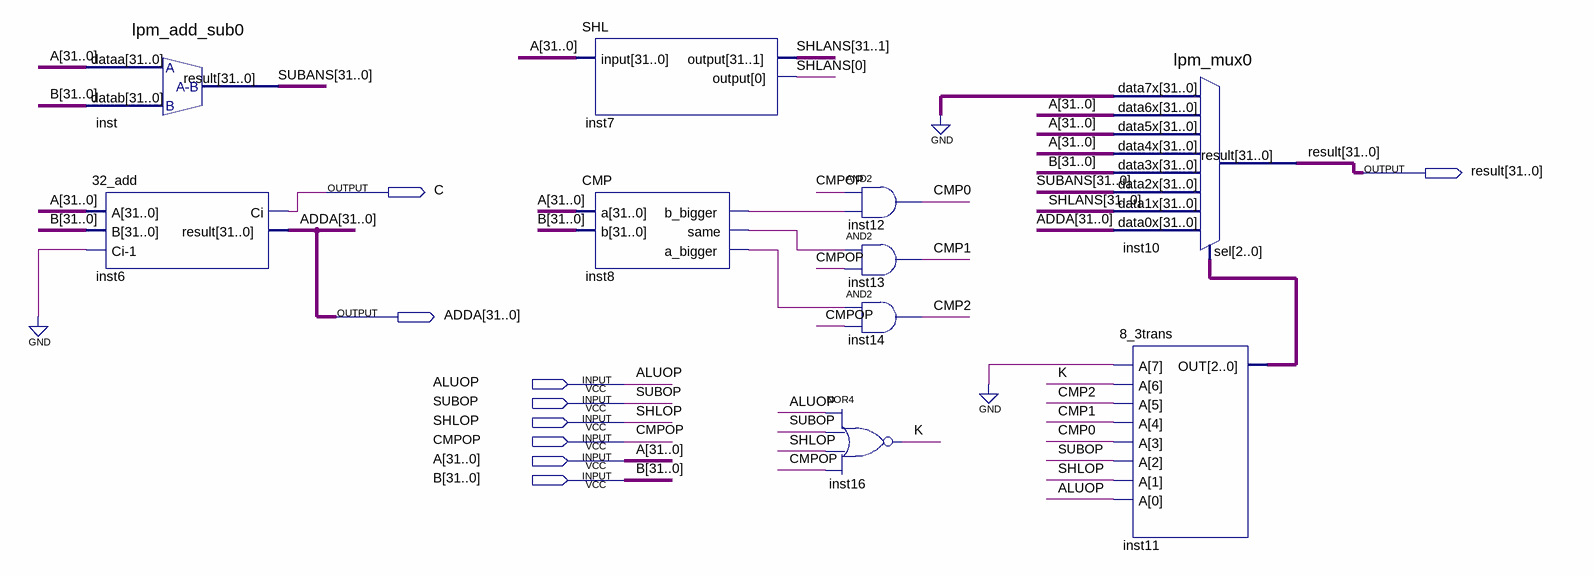
[diagram p0: schematic sheet]
// Quartus schematic ALU.bdf as structural Verilog: 10 symbols, 9 pins
module ALU (
  input  ALUOP,
  input  SUBOP,
  input  SHLOP,
  input  CMPOP,
  input  [31:0] A,
  input  [31:0] B,
  output [31:0] result,
  output C,
  output [31:0] ADDA
);

  wire CMP0, CMP1, CMP2, inst8_a_bigger, inst8_b_bigger, inst8_same, K;
  wire [2:0] inst11_out;
  wire [31:0] SHLANS, SUBANS;

  lpm_add_sub0 inst (.dataa(A), .datab(B), .result(SUBANS));
  \32_add  inst6 (.A(A), .B(B), .\Ci-1 (1'b0), .Ci(C), .result(ADDA));
  SHL inst7 (.\input (A), .\output (SHLANS));
  CMP inst8 (.a(A), .b(B), .b_bigger(inst8_b_bigger), .same(inst8_same), .a_bigger(inst8_a_bigger));
  nor inst16 (K, ALUOP, SUBOP, SHLOP, CMPOP);
  and inst12 (CMP0, CMPOP, inst8_b_bigger);
  and inst13 (CMP1, inst8_same, CMPOP);
  and inst14 (CMP2, inst8_a_bigger, CMPOP);
  lpm_mux0 inst10 (
    .data7x({32{1'b0}}), .data6x(A), .data5x(A), .data4x(A), .data3x(B), .data2x(SUBANS), .data1x(SHLANS),
    .data0x(ADDA), .sel(inst11_out), .result(result));
  \8_3trans  inst11 (.A({1'b0, K, CMP2, CMP1, CMP0, SUBOP, SHLOP, ALUOP}), .OUT(inst11_out));
endmodule
